# Altium schematic sheet Connectors.SchDoc: PDM
size A3; Author: Gustavo Gago; CompanyName: eUSRacing; DrawnBy: Gustavo Gago; SheetNumber: 7; SheetTotal: 8
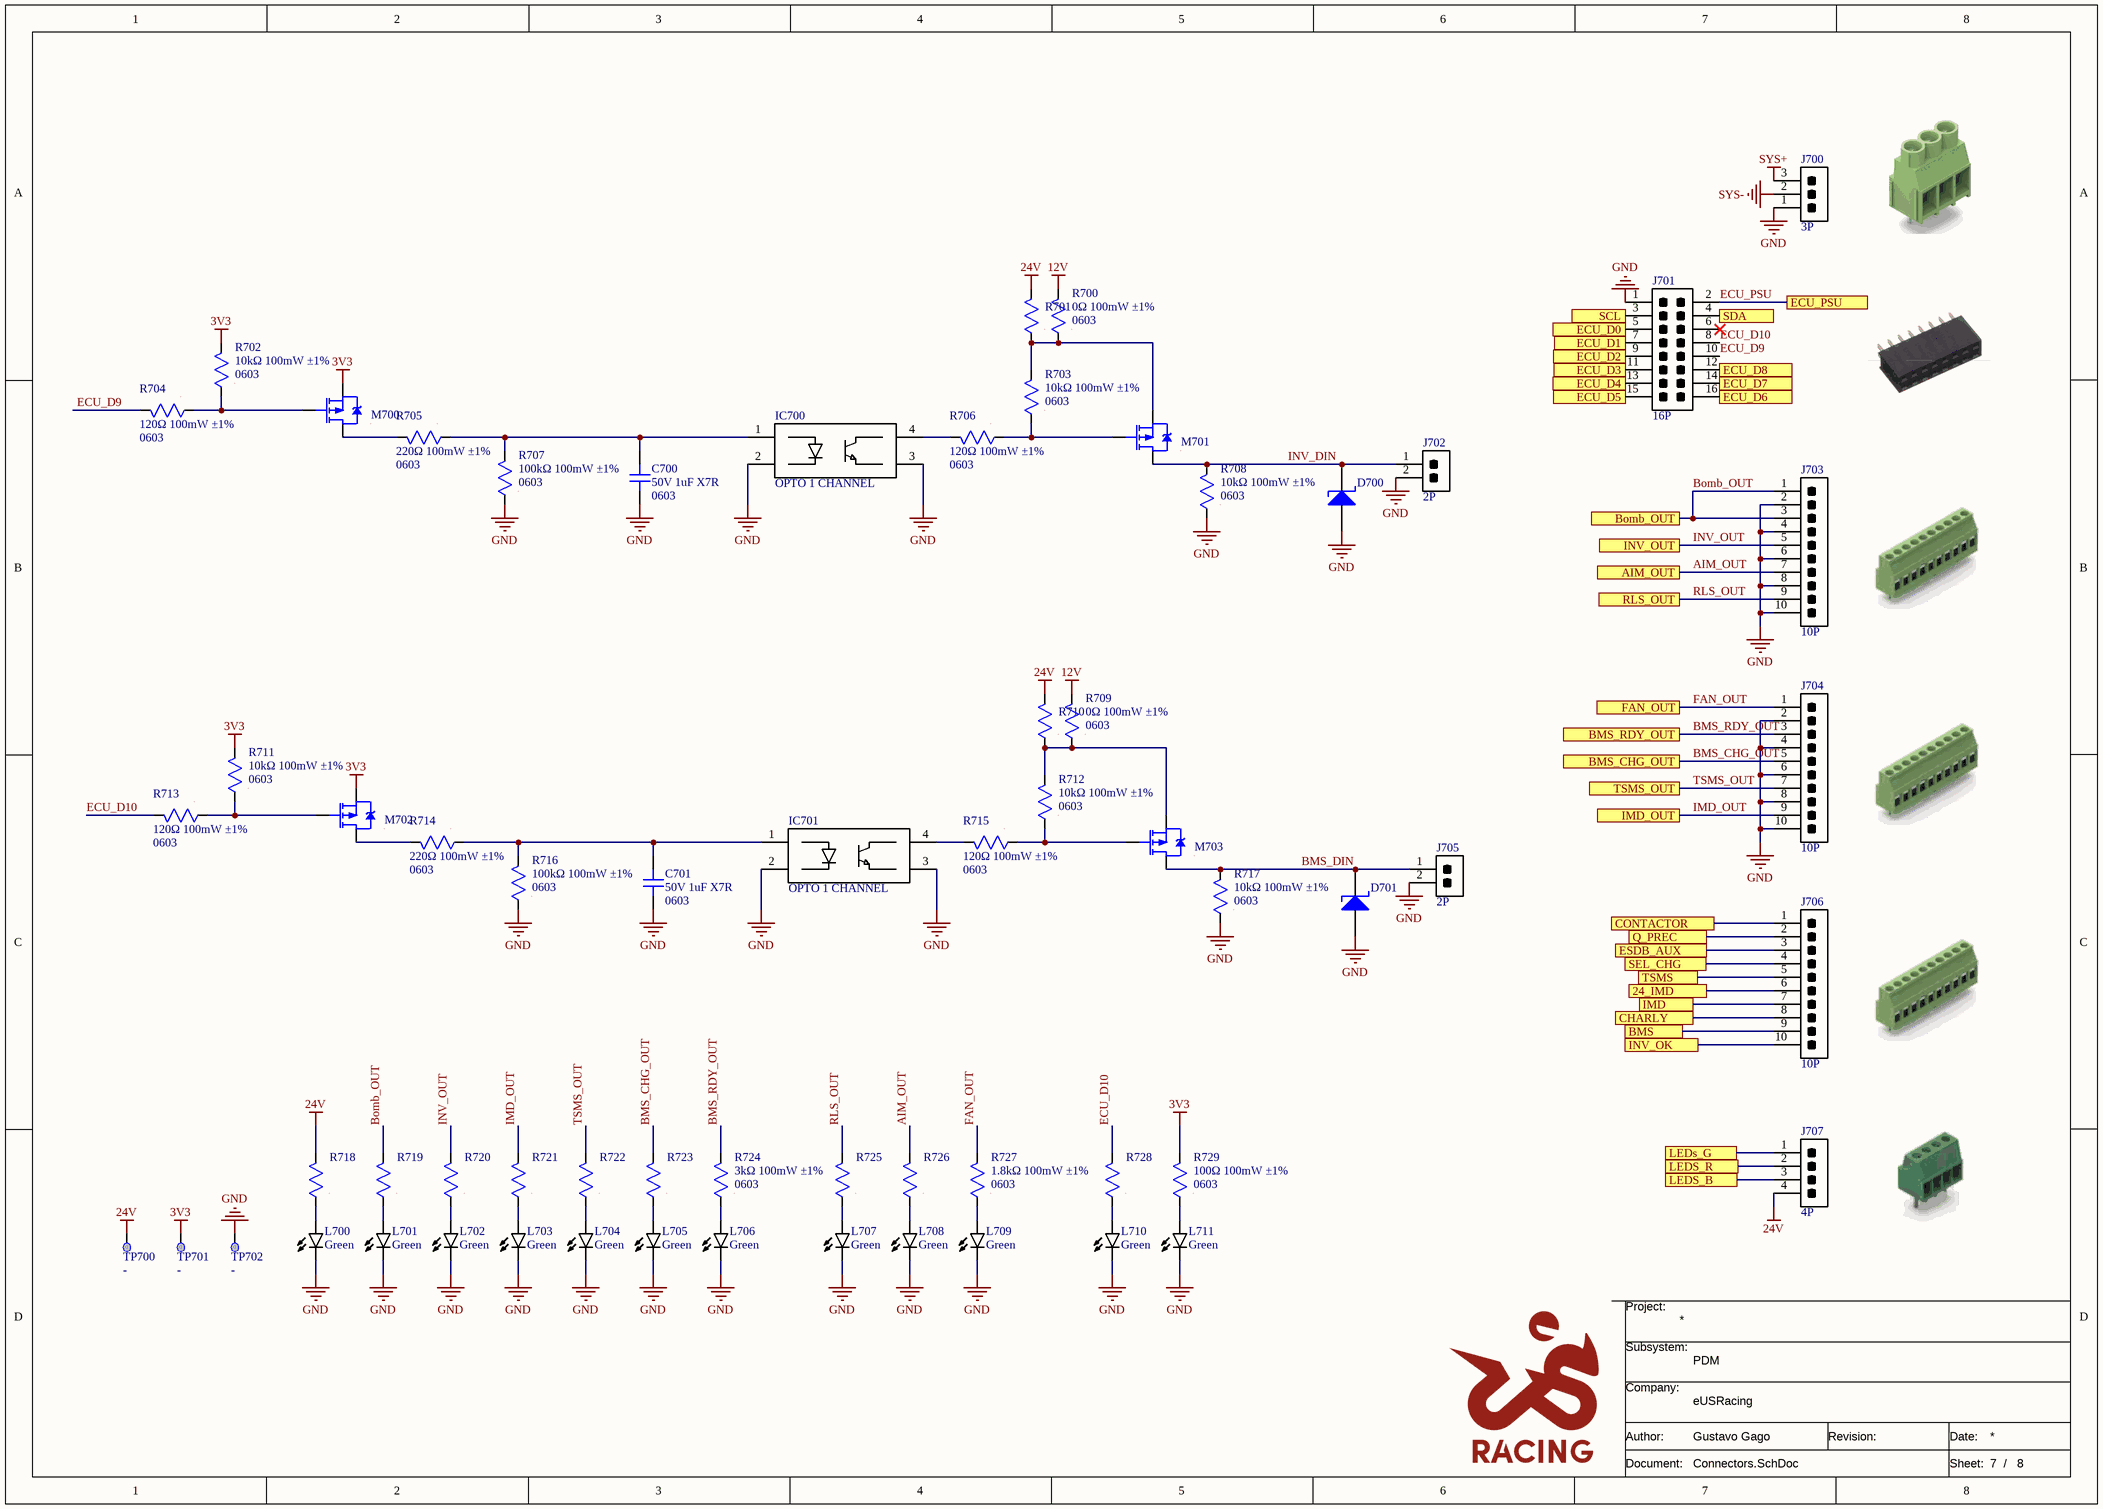
[diagram p0: Connectors.SchDoc]

## Parts
C700  value 50V 1uF X7R  Package: 0603  [CAP SMD 0603]  (hidden comment: CAP non polarized)
C701  value 50V 1uF X7R  Package: 0603  [CAP SMD 0603]  (hidden comment: CAP non polarized)
D700  DIODE SCHOTTKY  [DO-214AB]  (value not drawn)
D701  DIODE SCHOTTKY  [DO-214AB]  (value not drawn)
IC700  OPTO 1 CHANNEL  [DIP-4]
IC701  OPTO 1 CHANNEL  [DIP-4]
J700  value 3P  [691250610003]  (hidden comment: CONN 3P)
J701  value 16P  [61301621821]  (hidden comment: CONN 8P2R)
J702  value 2P  [PIN_HEADER_THT_2P]  (hidden comment: CONN 2P)
J703  value 10P  [691244710010]  (hidden comment: CONN 10P)
J704  value 10P  [691244710010]  (hidden comment: CONN 10P)
J705  value 2P  [PIN_HEADER_THT_2P]  (hidden comment: CONN 2P)
J706  value 10P  [691243110010]  (hidden comment: CONN 10P)
J707  value 4P  [691210910004]  (hidden comment: CONN 4P)
L700  value Green  [LED SMD 0603]  (hidden comment: LED WHITE)
L701  value Green  [LED SMD 0603]  (hidden comment: LED WHITE)
L702  value Green  [LED SMD 0603]  (hidden comment: LED WHITE)
L703  value Green  [LED SMD 0603]  (hidden comment: LED WHITE)
L704  value Green  [LED SMD 0603]  (hidden comment: LED WHITE)
L705  value Green  [LED SMD 0603]  (hidden comment: LED WHITE)
L706  value Green  [LED SMD 0603]  (hidden comment: LED WHITE)
L707  value Green  [LED SMD 0603]  (hidden comment: LED WHITE)
L708  value Green  [LED SMD 0603]  (hidden comment: LED WHITE)
L709  value Green  [LED SMD 0603]  (hidden comment: LED WHITE)
L710  value Green  [LED SMD 0603]  (hidden comment: LED WHITE)
L711  value Green  [LED SMD 0603]  (hidden comment: LED WHITE)
M700  MOSFET P  [SOT-23]  (value not drawn)
M701  MOSFET P  [SOT-23]  (value not drawn)
M702  MOSFET P  [SOT-23]  (value not drawn)
M703  MOSFET P  [SOT-23]  (value not drawn)
R700  value 0Ω 100mW ±1%  Package: 0603  [RES SMD 0603]  (hidden comment: RES)
R701  RES  [RES SMD 0603]  (value not drawn)
R702  value 10kΩ 100mW ±1%  Package: 0603  [RES SMD 0603]  (hidden comment: RES)
R703  value 10kΩ 100mW ±1%  Package: 0603  [RES SMD 0603]  (hidden comment: RES)
R704  value 120Ω 100mW ±1%  Package: 0603  [RES SMD 0603]  (hidden comment: RES)
R705  value 220Ω 100mW ±1%  Package: 0603  [RES SMD 0603]  (hidden comment: RES)
R706  value 120Ω 100mW ±1%  Package: 0603  [RES SMD 0603]  (hidden comment: RES)
R707  value 100kΩ 100mW ±1%  Package: 0603  [RES SMD 0603]  (hidden comment: RES)
R708  value 10kΩ 100mW ±1%  Package: 0603  [RES SMD 0603]  (hidden comment: RES)
R709  value 0Ω 100mW ±1%  Package: 0603  [RES SMD 0603]  (hidden comment: RES)
R710  RES  [RES SMD 0603]  (value not drawn)
R711  value 10kΩ 100mW ±1%  Package: 0603  [RES SMD 0603]  (hidden comment: RES)
R712  value 10kΩ 100mW ±1%  Package: 0603  [RES SMD 0603]  (hidden comment: RES)
R713  value 120Ω 100mW ±1%  Package: 0603  [RES SMD 0603]  (hidden comment: RES)
R714  value 220Ω 100mW ±1%  Package: 0603  [RES SMD 0603]  (hidden comment: RES)
R715  value 120Ω 100mW ±1%  Package: 0603  [RES SMD 0603]  (hidden comment: RES)
R716  value 100kΩ 100mW ±1%  Package: 0603  [RES SMD 0603]  (hidden comment: RES)
R717  value 10kΩ 100mW ±1%  Package: 0603  [RES SMD 0603]  (hidden comment: RES)
R718  RES  [RES SMD 0603]  (value not drawn)
R719  RES  [RES SMD 0603]  (value not drawn)
R720  RES  [RES SMD 0603]  (value not drawn)
R721  RES  [RES SMD 0603]  (value not drawn)
R722  RES  [RES SMD 0603]  (value not drawn)
R723  RES  [RES SMD 0603]  (value not drawn)
R724  value 3kΩ 100mW ±1%  Package: 0603  [RES SMD 0603]  (hidden comment: RES)
R725  RES  [RES SMD 0603]  (value not drawn)
R726  RES  [RES SMD 0603]  (value not drawn)
R727  value 1.8kΩ 100mW ±1%  Package: 0603  [RES SMD 0603]  (hidden comment: RES)
R728  RES  [RES SMD 0603]  (value not drawn)
R729  value 100Ω 100mW ±1%  Package: 0603  [RES SMD 0603]  (hidden comment: RES)
TP700  Test Point  [TP_SMD_1MM]  (value not drawn)  (no BOM)
TP701  Test Point  [TP_SMD_1MM]  (value not drawn)  (no BOM)
TP702  Test Point  [TP_SMD_1MM]  (value not drawn)  (no BOM)

## Ports
24_IMD, AIM_OUT, BMS, BMS_CHG_OUT, BMS_RDY_OUT, Bomb_OUT, CHARLY, CONTACTOR, ECU_D0, ECU_D1, ECU_D2, ECU_D3, ECU_D4, ECU_D5, ECU_D6, ECU_D7, ECU_D8, ECU_PSU, ESDB_AUX, FAN_OUT, IMD, IMD_OUT, INV_OK, INV_OUT, LEDS_B, LEDs_G, LEDS_R, Q_PREC, RLS_OUT, SCL, SDA, SEL_CHG, TSMS, TSMS_OUT

## Nets
3V3: M700.2(S) M702.2(S) R702.2 R711.2 R729.2 TP701.1
12V: R700.2 R709.2
24V: J707.4 R701.2 R710.2 R718.2 TP700.1
GND: C700.2 C701.2 D700.A D701.A IC700.2(K_1) IC700.3(E_1) IC701.2(K_1) IC701.3(E_1) J700.1 J701.1 J702.2 J703.2 J703.4 J703.6 J703.8 J703.10 J704.2 J704.4 J704.6 J704.8 J704.10 J705.2 L700.C L701.C L702.C L703.C L704.C L705.C L706.C L707.C L708.C L709.C L710.C L711.C R707.1 R708.1 R716.1 R717.1 TP702.1
SYS+: J700.3
SYS-: J700.2
24_IMD: J706.6 ; port 24_IMD
AIM_OUT: J703.7 R726.2 ; port AIM_OUT
BMS: J706.9 ; port BMS
BMS_CHG_OUT: J704.5 R723.2 ; port BMS_CHG_OUT
BMS_DIN: D701.K J705.1 M703.3(D) R717.2
BMS_RDY_OUT: J704.3 R724.2 ; port BMS_RDY_OUT
Bomb_OUT: J703.1 J703.3 R719.2 ; port Bomb_OUT
CHARLY: J706.8 ; port CHARLY
CONTACTOR: J706.1 ; port CONTACTOR
ECU_D0: J701.5 ; port ECU_D0
ECU_D1: J701.7 ; port ECU_D1
ECU_D2: J701.9 ; port ECU_D2
ECU_D3: J701.11 ; port ECU_D3
ECU_D4: J701.13 ; port ECU_D4
ECU_D5: J701.15 ; port ECU_D5
ECU_D6: J701.16 ; port ECU_D6
ECU_D7: J701.14 ; port ECU_D7
ECU_D8: J701.12 ; port ECU_D8
ECU_D9: J701.10 R704.2
ECU_D10: J701.8 R713.2 R728.2
ECU_PSU: J701.2 ; port ECU_PSU
ESDB_AUX: J706.3 ; port ESDB_AUX
FAN_OUT: J704.1 R727.2 ; port FAN_OUT
IMD: J706.7 ; port IMD
IMD_OUT: J704.9 R721.2 ; port IMD_OUT
INV_DIN: D700.K J702.1 M701.3(D) R708.2
INV_OK: J706.10 ; port INV_OK
INV_OUT: J703.5 R720.2 ; port INV_OUT
LEDS_B: J707.3 ; port LEDS_B
LEDs_G: J707.1 ; port LEDs_G
LEDS_R: J707.2 ; port LEDS_R
Q_PREC: J706.2 ; port Q_PREC
RLS_OUT: J703.9 R725.2 ; port RLS_OUT
SCL: J701.3 ; port SCL
SDA: J701.4 ; port SDA
SEL_CHG: J706.4 ; port SEL_CHG
TSMS: J706.5 ; port TSMS
TSMS_OUT: J704.7 R722.2 ; port TSMS_OUT
NetC700_1: C700.1 IC700.1(A_1) R705.1 R707.2
NetC701_1: C701.1 IC701.1(A_1) R714.1 R716.2
NetIC700_4: IC700.4(C_1) R706.2
NetIC701_4: IC701.4(C_1) R715.2
NetL700_A: L700.A R718.1
NetL701_A: L701.A R719.1
NetL702_A: L702.A R720.1
NetL703_A: L703.A R721.1
NetL704_A: L704.A R722.1
NetL705_A: L705.A R723.1
NetL706_A: L706.A R724.1
NetL707_A: L707.A R725.1
NetL708_A: L708.A R726.1
NetL709_A: L709.A R727.1
NetL710_A: L710.A R728.1
NetL711_A: L711.A R729.1
NetM700_1: M700.1(G) R702.1 R704.1
NetM700_3: M700.3(D) R705.2
NetM701_1: M701.1(G) R703.1 R706.1
NetM701_2: M701.2(S) R700.1 R701.1 R703.2
NetM702_1: M702.1(G) R711.1 R713.1
NetM702_3: M702.3(D) R714.2
NetM703_1: M703.1(G) R712.1 R715.1
NetM703_2: M703.2(S) R709.1 R710.1 R712.2

Not connected (* = marked no-connect by the designer): J701 6*

## Notes on the sheet
- Project:
- Subsystem:
- Company:
- Document:
- Author:
- Revision:
- Date:
- Sheet:
- /

## Library data of the parts
C700 C701 = 001-0102: Condensadores de cerámica multicapa (MLCC- SMD/SMT) WCAP-CSGP 1uF 50 Vol 10%; MPN: 885012206126; Manufacturer: Wurth Elektronik; ComponentLink1Description: Datasheet; ComponentLink1URL: https://www.we-online.com/components/products/datasheet/885012206126.pdf; ComponentLink2Description: Distributor Link; ComponentLink2URL: https://www.mouser.es/ProductDetail/Wurth-Elektronik/885012206126?qs=amGC7iS6iy%2F%252BJOLb%2FSuwig%3D%3D; ID: 001-0102; Distributor PN: 710-885012206126; Distributor: Mouser
D700 D701 = 031-0013: Diodos y rectificadores Schottky 3A 60V; MPN: MBRS360T3G; Manufacturer: onsemi; Value: 60V 3A; ComponentLink1Description: Datasheet; ComponentLink1URL: https://www.onsemi.com/pdf/datasheet/mbrs360t3-d.pdf; ComponentLink2Description: Distributor Link; ComponentLink2URL: https://www.mouser.es/ProductDetail/onsemi/MBRS360T3G?qs=3JMERSakebpuPnGIg0cvPA%3D%3D; ID: 031-0013; Package: DO-214AB; Distributor PN: 863-MBRS360T3G; Distributor: Mouser
IC700 IC701 = 041-0003: Optoacopladores para salidas de transistores WL-OCPT 35V 5KVrms 10pF Dip 4 S-Type; MPN: 140817142400; Manufacturer: Wurth Elektronik; ComponentLink1Description: Datasheet; ComponentLink1URL: https://www.we-online.com/catalog/datasheet/140817142400.pdf; ComponentLink2Description: Distributor Link; ComponentLink2URL: https://www.mouser.es/es/ProductDetail/Wurth-Elektronik/140817142400?qs=81r%252BiQLm7BQPLeRqqgk3BQ%3D%3D; ID: 041-0003; Value: -; Package: DIP-4; Distributor PN: 710-140817142400; Distributor: Mouser
J700 = 110-0076: Bloques terminales fijos WR-TBL Terminal block - Rising Cage - THT; Manufacturer: Wurth Elektronik; ComponentLink1Description: Datasheet; ComponentLink1URL: https://www.we-online.com/components/products/datasheet/691250610003.pdf; ComponentLink2Description: Distributor Link; ComponentLink2URL: https://www.mouser.es/es/ProductDetail/Wurth-Elektronik/691250610003?qs=sPbYRqrBIVkXxexBFWk11Q%3D%3D; ID: 110-0076; Package: THT 6,35mm; MPN: 691250610003; Distributor PN: 710-691250610003; Distributor: Mouser
J701 = 110-0080: Alojamientos de cables y cabecera WR-PHD 2.54 mm Dual Socket Header; Manufacturer: Wurth Elektronik; ComponentLink1Description: Datasheet; ComponentLink1URL: https://www.we-online.com/components/products/datasheet/61301621821.pdf; ComponentLink2Description: Distributor Link; ComponentLink2URL: https://www.mouser.es/es/ProductDetail/Wurth-Elektronik/61301621821?qs=GedFDFLaBXGpn7FxmOhVBw%3D%3D; ID: 110-0080; Package: THT 2,54mm; MPN: 61301621821; Distributor PN: 710-61301621821; Distributor: Mouser
J702 J705 = 110-0061: Alojamientos de cables y cabecera 2.54MM HIGH TEMP PCB HDR STRIP; MPN: HTSW-102-07-G-S; Manufacturer: Samtec; ComponentLink1Description: Datasheet; ComponentLink1URL: https://www.mouser.es/datasheet/3/85/1/htsw_th.pdf; ComponentLink2Description: Distributor Link; ComponentLink2URL: https://www.mouser.es/ProductDetail/Samtec/HTSW-102-07-G-S?qs=FESYatJ8odI1BCBanfu%2FIg%3D%3D; ID: 110-0061; Package: THT 2,54mm; Distributor PN: 200-HTSW10207GS; Distributor: Mouser
J703 J704 = 110-0077: Bloques terminales fijos WR-TBL 7.5mmPitch 10P Rising Cage; Manufacturer: Wurth Elektronik; ComponentLink1Description: Datasheet; ComponentLink1URL: https://www.we-online.com/components/products/datasheet/691244710010.pdf; ComponentLink2Description: Distributor Link; ComponentLink2URL: https://www.mouser.es/es/ProductDetail/Wurth-Elektronik/691244710010?qs=sPbYRqrBIVkeUTyogk8U2w%3D%3D; ID: 110-0077; Package: THT 5mm; MPN: 691244710010; Distributor PN: 710-691244710010; Distributor: Mouser
J706 = 110-0081: Bloques terminales fijos WR-TBL 3.50mm Pitch Rising Cage 10P; Manufacturer: Wurth Elektronik; ComponentLink1Description: Datasheet; ComponentLink1URL: https://www.we-online.com/components/products/datasheet/691243110010.pdf; ComponentLink2Description: Distributor Link; ComponentLink2URL: https://www.mouser.es/es/ProductDetail/Wurth-Elektronik/691243110010?qs=sPbYRqrBIVnids3gJEo%252B3g%3D%3D; ID: 110-0081; Package: THT 3,5mm; MPN: 691243110010; Distributor PN: 710-691243110010; Distributor: Mouser
J707 = 110-0078: Bloques terminales fijos WR-TBL 2.54mm Pitch Rising Cage 4P; Manufacturer: Wurth Elektronik; ComponentLink1Description: Datasheet; ComponentLink1URL: https://www.we-online.com/components/products/datasheet/691210910004.pdf; ComponentLink2Description: Distributor Link; ComponentLink2URL: https://www.mouser.es/es/ProductDetail/Wurth-Elektronik/691210910004?qs=sPbYRqrBIVlxffWXw70IkA%3D%3D&srsltid=AYCX9vImtK9nBbe8FreLTyeGBLcv8S9XpxrOovdtqTwbitEoahFgVlw_; ID: 110-0078; Package: THT 2,54mm; MPN: 691210910004; Distributor PN: 710-691210910004; Distributor: Mouser
L700-L711 = 033-0023: LED de un solo color Green 525nm 1400mcd 2.85V 73deg 0603; MPN: VLMTG1400-GS08; Manufacturer: Vishay Semiconductors; ComponentLink1Description: Datasheet; ComponentLink1URL: https://www.vishay.com/docs/84393/vlmtg1400.pdf; ComponentLink2Description: Distributor Link; ComponentLink2URL: https://www.mouser.es/ProductDetail/Vishay-Semiconductors/VLMTG1400-GS08?qs=gt1LBUVyoHlZ6yHd8iEIzQ%3D%3D; ID: 033-0023; Package: 0603; Distributor PN: 78-VLMTG1400-GS08; Distributor: Mouser
M700-M703 = 043-0002: MOSFET -30V Vds 20V Vgs SOT-23; MPN: SI2303CDS-T1-GE3; Manufacturer: Vishay Semiconductors; ComponentLink1Description: Datasheet; ComponentLink1URL: https://www.vishay.com/docs/69991/si2303cd.pdf; ComponentLink2Description: Distributor Link; ComponentLink2URL: https://www.mouser.es/ProductDetail/Vishay-Semiconductors/SI2303CDS-T1-GE3?qs=IRuQNBqMOckJHxNXLRBkmw%3D%3D; ID: 043-0002; Value: P; Package: SOT-23-3; Distributor PN: 781-SI2303CDS-T1-GE3; Distributor: Mouser
R700 R709 = 010-0160: Resistores de película gruesa - SMD WRIS-RSKS <0.05 Ohms 0.1 W Jumper 0603 AEC-Q200; MPN: 560112116001; Manufacturer: Wurth Elektronik; ComponentLink1Description: Datasheet; ComponentLink1URL: https://www.we-online.com/components/products/datasheet/560112116001.pdf; ComponentLink2Description: Distributor Link; ComponentLink2URL: https://www.mouser.es/ProductDetail/Wurth-Elektronik/560112116001?qs=mELouGlnn3dlnHYj7TecuA%3D%3D; ID: 010-0160; Distributor PN: 710-560112116001; Distributor: Mouser
R701 R710 = 010-0160: Resistores de película gruesa - SMD WRIS-RSKS <0.05 Ohms 0.1 W Jumper 0603 AEC-Q200; MPN: 560112116001; Manufacturer: Wurth Elektronik; Value: 0Ω 100mW ±1%; ComponentLink1Description: Datasheet; ComponentLink1URL: https://www.we-online.com/components/products/datasheet/560112116001.pdf; ComponentLink2Description: Distributor Link; ComponentLink2URL: https://www.mouser.es/ProductDetail/Wurth-Elektronik/560112116001?qs=mELouGlnn3dlnHYj7TecuA%3D%3D; Package: 0603; ID: 010-0160; Distributor PN: 710-560112116001; Distributor: Mouser
R702 R703 R708 R711 R712 R717 = 010-0145: Resistores de película gruesa - SMD WRIS-RSKS 10 kOhms 1 % 0.1 W 0603 AEC-Q200; MPN: 560112116005; Manufacturer: Wurth Elektronik; ComponentLink1Description: Datasheet; ComponentLink1URL: https://www.we-online.com/components/products/datasheet/560112116005.pdf; ComponentLink2Description: Distributor Link; ComponentLink2URL: https://www.mouser.es/ProductDetail/Wurth-Elektronik/560112116005?qs=mELouGlnn3dMVSPHwBGouA%3D%3D; ID: 010-0145; Distributor PN: 710-560112116005; Distributor: Mouser
R704 R706 R713 R715 = 010-0177: Resistores de película gruesa - SMD WRIS-RSKS 120 Ohms 1 % 0.1 W 0603 AEC-Q200; MPN: 560112116119; Manufacturer: Wurth Elektronik; ComponentLink1Description: Datasheet; ComponentLink1URL: https://www.we-online.com/components/products/datasheet/560112116119.pdf; ComponentLink2Description: Distributor Link; ComponentLink2URL: https://www.mouser.es/ProductDetail/Wurth-Elektronik/560112116119?qs=mELouGlnn3eT%2F22oIMY8Ng%3D%3D; ID: 010-0177; Distributor PN: 710-560112116119; Distributor: Mouser
R705 R714 = 010-0191: Resistores de película gruesa - SMD WRIS-RSKS 220 Ohms 1 % 0.1 W 0603 AEC-Q200; MPN: 560112116126; Manufacturer: Wurth Elektronik; ComponentLink1Description: Datasheet; ComponentLink1URL: https://www.we-online.com/components/products/datasheet/560112116126.pdf; ComponentLink2Description: Distributor Link; ID: 010-0191; Distributor PN: 710-560112116126; Distributor: Mouser
R707 R716 = 010-0190: Thick Film Resistors WRIS-RSKS 100 kOhms 1 % 0.1 W 0603 AEC-Q200; MPN: 560112116004; Manufacturer: Wurth Elektronik; ComponentLink1Description: Datasheet; ComponentLink1URL: https://www.we-online.com/components/products/datasheet/560112116004.pdf; ComponentLink2Description: Distributor Link; ComponentLink2URL: https://www.mouser.es/ProductDetail/Wurth-Elektronik/560112116004?qs=sGAEpiMZZMvdGkrng054txLI%2FDB4oIKDB%252BmfBE1ySSGuQklCN21gzA%3D%3D; ID: 010-0190; Distributor PN: 710-560112116004; Distributor: Mouser
R718-R723 = 010-0192: Thick Film Resistors - SMD WRIS-RSKS 3 kOhms 1 % 0.1 W 0603 AEC-Q200; MPN: 560112116128; Manufacturer: Wurth Elektronik; Value: 3kΩ 100mW ±1%; ComponentLink1Description: Datasheet; ComponentLink1URL: https://www.we-online.com/components/products/datasheet/560112116128.pdf; ComponentLink2Description: Distributor Link; ComponentLink2URL: https://www.mouser.es/en/ProductDetail/Wurth-Elektronik/560112116128?qs=mELouGlnn3d9zmvF5OWSLQ%3D%3D; Package: 0603; ID: 010-0192; Distributor PN: 710-560112116128; Distributor: Mouser
R724 = 010-0192: Thick Film Resistors - SMD WRIS-RSKS 3 kOhms 1 % 0.1 W 0603 AEC-Q200; MPN: 560112116128; Manufacturer: Wurth Elektronik; ComponentLink1Description: Datasheet; ComponentLink1URL: https://www.we-online.com/components/products/datasheet/560112116128.pdf; ComponentLink2Description: Distributor Link; ComponentLink2URL: https://www.mouser.es/en/ProductDetail/Wurth-Elektronik/560112116128?qs=mELouGlnn3d9zmvF5OWSLQ%3D%3D; ID: 010-0192; Distributor PN: 710-560112116128; Distributor: Mouser
R725 R726 = 010-0146: Resistores de película gruesa - SMD WRIS-RSKS 1.8 kOhms 1 % 0.1 W 0603 AEC-Q200; MPN: 560112116032; Manufacturer: Wurth Elektronik; Value: 1.8kΩ 100mW ±1%; ComponentLink1Description: Datasheet; ComponentLink1URL: https://www.we-online.com/components/products/datasheet/560112116032.pdf; ComponentLink2Description: Distributor Link; ComponentLink2URL: https://www.mouser.es/ProductDetail/Wurth-Elektronik/560112116032?qs=mELouGlnn3dPZZEXKb4zAQ%3D%3D; Package: 0603; ID: 010-0146; Distributor PN: 710-560112116032; Distributor: Mouser
R727 = 010-0146: Resistores de película gruesa - SMD WRIS-RSKS 1.8 kOhms 1 % 0.1 W 0603 AEC-Q200; MPN: 560112116032; Manufacturer: Wurth Elektronik; ComponentLink1Description: Datasheet; ComponentLink1URL: https://www.we-online.com/components/products/datasheet/560112116032.pdf; ComponentLink2Description: Distributor Link; ComponentLink2URL: https://www.mouser.es/ProductDetail/Wurth-Elektronik/560112116032?qs=mELouGlnn3dPZZEXKb4zAQ%3D%3D; ID: 010-0146; Distributor PN: 710-560112116032; Distributor: Mouser
R728 = 010-0172: Thick Film Resistors WRIS-RSKS 100 Ohms 1 % 0.1 W 0603 AEC-Q200; MPN: 560112116009; Manufacturer: Wurth Elektronik; Value: 100Ω 100mW ±1%; ComponentLink1Description: Datasheet; ComponentLink1URL: https://www.we-online.com/components/products/datasheet/560112116009.pdf; ComponentLink2Description: Distributor Link; ComponentLink2URL: https://www.mouser.es/ProductDetail/Wurth-Elektronik/560112116009?qs=sGAEpiMZZMvdGkrng054txLI%2FDB4oIKDTCqaE%2Fpesdwv2JWXHdCmlQ%3D%3D; Package: 0603; ID: 010-0172; Distributor PN: 710-560112116009; Distributor: Mouser
R729 = 010-0172: Thick Film Resistors WRIS-RSKS 100 Ohms 1 % 0.1 W 0603 AEC-Q200; MPN: 560112116009; Manufacturer: Wurth Elektronik; ComponentLink1Description: Datasheet; ComponentLink1URL: https://www.we-online.com/components/products/datasheet/560112116009.pdf; ComponentLink2Description: Distributor Link; ComponentLink2URL: https://www.mouser.es/ProductDetail/Wurth-Elektronik/560112116009?qs=sGAEpiMZZMvdGkrng054txLI%2FDB4oIKDTCqaE%2Fpesdwv2JWXHdCmlQ%3D%3D; ID: 010-0172; Distributor PN: 710-560112116009; Distributor: Mouser
TP700-TP702 = 110-0007: ComponentLink1URL: *; ComponentLink1Description: Datasheet; ComponentLink2Description: Distributor Link; ComponentLink2URL: -; ID: 110-0007; Value: -; Package: -; MPN: -; Manufacturer: -; Distributor PN: -; Distributor: -